# Altium schematic sheet ide_podule-16bit.SchDoc
size 420 x 297 mm
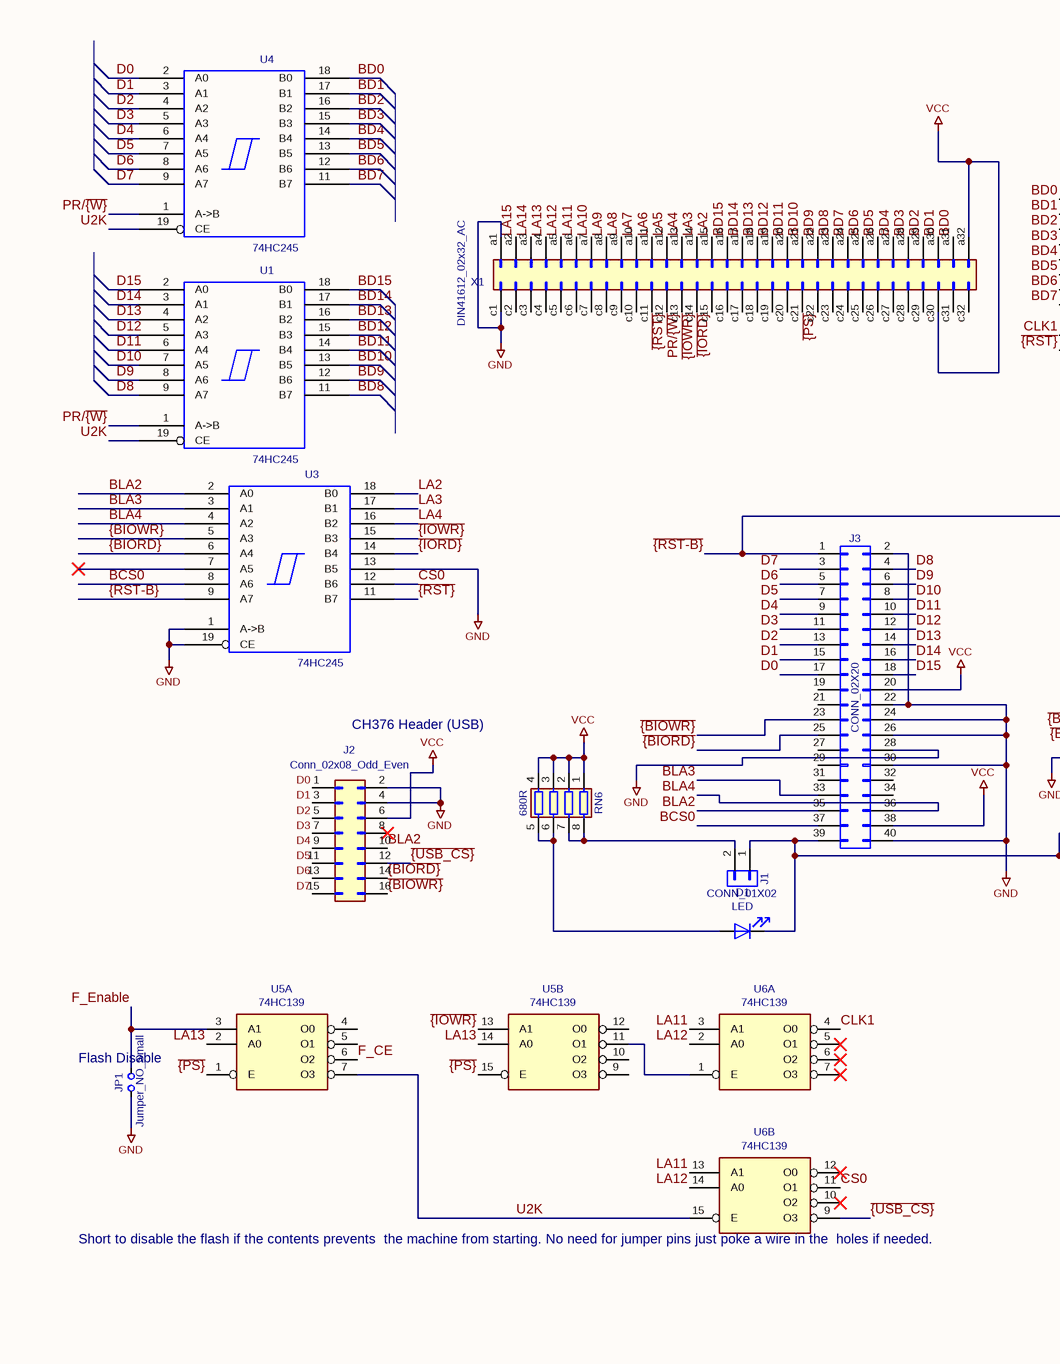
[diagram p0: ide_podule-16bit.SchDoc, left]
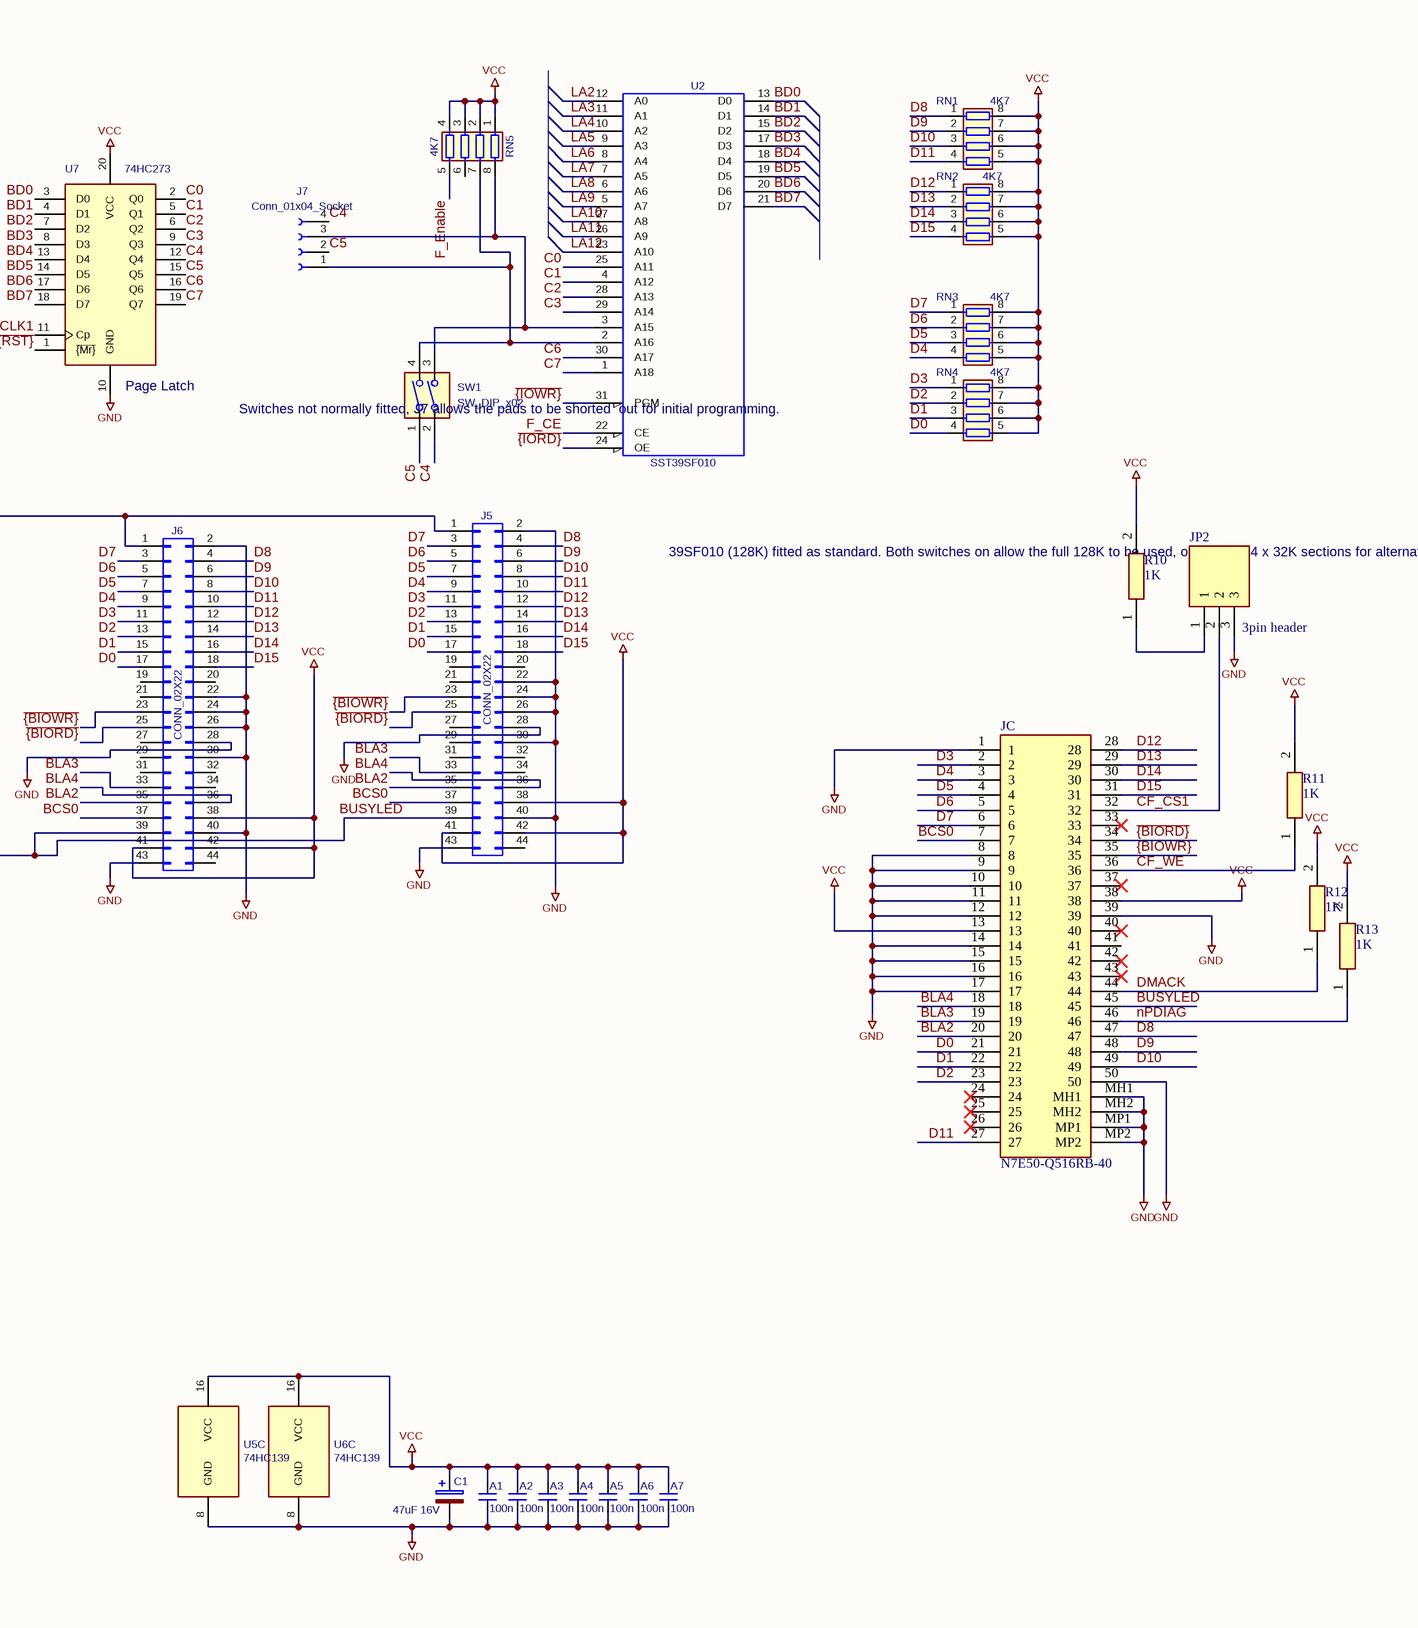
[diagram p1: ide_podule-16bit.SchDoc, right]

## Parts
A1  100n  [RESC2012X50N]
A2  100n  [RESC2012X50N]
A3  100n  [RESC2012X50N]
A4  100n  [RESC2012X50N]
A5  100n  [RESC2012X50N]
A6  100n  [RESC2012X50N]
A7  100n  [RESC2012X50N]
C1  47uF 16V  [CP_Elec_6.3x5.8]
D1  LED  [LED_1206_3216Metric]
J1  CONN_01X02  [PinHeader_1x02_P2.54mm_Vertical]
J2  Conn_02x08_Odd_Even  [CH376-mod]
J3  CONN_02X20  [PinHeader_2x20_P2.54mm_Vertical]
J5  CONN_02X22  [PinHeader_2x22_P2.00mm_Vertical]
J6  CONN_02X22  [IDE-edge-44pinC]
J7  Conn_01x04_Socket  [4 way edge]
JC  N7E50-Q516RB-40  [N7E50Q516RB40]
JP1  Jumper_NO_Small  [PinHeader_1x02_P2.54mm_Vertical]
JP2  3pin header  [HDRV3W64P254_1X3_762X241X838P]
R10  1K  [RESC1608X50N]
R11  1K  [RESC1608X50N]
R12  1K  [RESC1608X50N]
R13  1K  [RESC1608X50N]
RN1  4K7  [R_Array_Convex_4x0603]
RN2  4K7  [R_Array_Convex_4x0603]
RN3  4K7  [R_Array_Convex_4x0603]
RN4  4K7  [R_Array_Convex_4x0603]
RN5  4K7  [R_Array_Convex_4x0603]
RN6  680R  [R_Array_Convex_4x0603]
SW1  SW_DIP_x02  [DIP-4_W7.62mm_Socket]
U1  74HC245  [SOIC-20W_7.5x12.8mm_P1.27mm]
U2  SST39SF010  [PLCC-32_11.4x14.0mm_P1.27mm]
U3  74HC245  [SOIC-20W_7.5x12.8mm_P1.27mm]
U4  74HC245  [SOIC-20W_7.5x12.8mm_P1.27mm]
U5  74HC139  [STC_SOP-16_3.9x9.9mm_P1.27mm]  (parts A,B,C of 3)
U6  74HC139  [STC_SOP-16_3.9x9.9mm_P1.27mm]  (parts A,B,C of 3)
U7  74HC273  [SOIC-20W_7.5x12.8mm_P1.27mm]
X1  DIN41612_02x32_AC  [DIN41612_C_2x32_Male_Horizontal_THT]

## Nets
GND: A1.2 A2.2 A3.2 A4.2 A5.2 A6.2 A7.2 C1.2 J2.2(Pin_2) J2.4(Pin_4) J3.2(P2) J3.22(P22) J3.24(P24) J3.26(P26) J3.28(P28) J3.30(P30) J3.40(P40) J5.2(P2) J5.22(P22) J5.24(P24) J5.26(P26) J5.28(P28) J5.30(P30) J5.40(P40) J5.43(P43) J6.2(P2) J6.22(P22) J6.24(P24) J6.26(P26) J6.28(P28) J6.30(P30) J6.40(P40) J6.43(P43) JC.1 JC.8 JC.9 JC.10 JC.11 JC.12 JC.14 JC.15 JC.16 JC.17 JC.39 JC.50 JC.MH1 JC.MH2 JC.MP1 JC.MP2 JP1.1 JP2.3 U3.1(A->B) U3.13(B5) U3.19(CE) U5.8(GND) U6.8(GND) U7.10(GND) X1.a1(Pin_a1) X1.c1(Pin_c1)
VCC: A1.1 A2.1 A3.1 A4.1 A5.1 A6.1 A7.1 C1.1 J2.6(Pin_6) J3.20(P20) J3.38(P38) J5.38(P38) J5.41(P41) J5.42(P42) J6.38(P38) J6.41(P41) J6.42(P42) JC.13 JC.38 R10.2 R11.2 R12.2 R13.2 RN1.5(R4.2) RN1.6(R3.2) RN1.7(R2.2) RN1.8(R1.2) RN2.5(R4.2) RN2.6(R3.2) RN2.7(R2.2) RN2.8(R1.2) RN3.5(R4.2) RN3.6(R3.2) RN3.7(R2.2) RN3.8(R1.2) RN4.5(R4.2) RN4.6(R3.2) RN4.7(R2.2) RN4.8(R1.2) RN5.1(R1.1) RN5.2(R2.1) RN5.3(R3.1) RN5.4(R4.1) RN6.1(R1.1) RN6.2(R2.1) RN6.3(R3.1) RN6.4(R4.1) U5.16(VCC) U6.16(VCC) U7.20(VCC) X1.a32(Pin_a32) X1.c30(Pin_c30)
BCS0: J3.37(P37) J5.37(P37) J6.37(P37) JC.7 U3.8(A6)
BD0: U2.13(D0) U4.18(B0) U7.3(D0) X1.a31(Pin_a31)
BD1: U2.14(D1) U4.17(B1) U7.4(D1) X1.a30(Pin_a30)
BD2: U2.15(D2) U4.16(B2) U7.7(D2) X1.a29(Pin_a29)
BD3: U2.17(D3) U4.15(B3) U7.8(D3) X1.a28(Pin_a28)
BD4: U2.18(D4) U4.14(B4) U7.13(D4) X1.a27(Pin_a27)
BD5: U2.19(D5) U4.13(B5) U7.14(D5) X1.a26(Pin_a26)
BD6: U2.20(D6) U4.12(B6) U7.17(D6) X1.a25(Pin_a25)
BD7: U2.21(D7) U4.11(B7) U7.18(D7) X1.a24(Pin_a24)
BD8: U1.11(B7) X1.a23(Pin_a23)
BD9: U1.12(B6) X1.a22(Pin_a22)
BD10: U1.13(B5) X1.a21(Pin_a21)
BD11: U1.14(B4) X1.a20(Pin_a20)
BD12: U1.15(B3) X1.a19(Pin_a19)
BD13: U1.16(B2) X1.a18(Pin_a18)
BD14: U1.17(B1) X1.a17(Pin_a17)
BD15: U1.18(B0) X1.a16(Pin_a16)
BLA2: J2.10(Pin_10) J3.35(P35) J5.35(P35) J6.35(P35) JC.20 U3.2(A0)
BLA3: J3.33(P33) J5.33(P33) J6.33(P33) JC.19 U3.3(A1)
BLA4: J3.36(P36) J5.36(P36) J6.36(P36) JC.18 U3.4(A2)
BUSYLED: D1.1(K) J1.1(P1) J3.39(P39) J5.39(P39) J6.39(P39) JC.45
C0: U2.25(A11) U7.2(Q0)
C1: U2.4(A12) U7.5(Q1)
C2: U2.28(A13) U7.6(Q2)
C3: U2.29(A14) U7.9(Q3)
C4: J7.4(Pin_4) SW1.2 U7.12(Q4)
C5: J7.2(Pin_2) SW1.1 U7.15(Q5)
C6: U2.30(A17) U7.16(Q6)
C7: U2.1(A18) U7.19(Q7)
CF_CS1: JC.32 JP2.2
CF_WE: JC.36 R11.1
CLK1: U6.4(O0) U7.11(Cp)
CS0: U3.12(B6) U6.11(O1)
D0: J2.1(Pin_1) J3.17(P17) J5.17(P17) J6.17(P17) JC.21 RN4.4(R4.1) U4.2(A0)
D1: J2.3(Pin_3) J3.15(P15) J5.15(P15) J6.15(P15) JC.22 RN4.3(R3.1) U4.3(A1)
D2: J2.5(Pin_5) J3.13(P13) J5.13(P13) J6.13(P13) JC.23 RN4.2(R2.1) U4.4(A2)
D3: J2.7(Pin_7) J3.11(P11) J5.11(P11) J6.11(P11) JC.2 RN4.1(R1.1) U4.5(A3)
D4: J2.9(Pin_9) J3.9(P9) J5.9(P9) J6.9(P9) JC.3 RN3.4(R4.1) U4.6(A4)
D5: J2.11(Pin_11) J3.7(P7) J5.7(P7) J6.7(P7) JC.4 RN3.3(R3.1) U4.7(A5)
D6: J2.13(Pin_13) J3.5(P5) J5.5(P5) J6.5(P5) JC.5 RN3.2(R2.1) U4.8(A6)
D7: J2.15(Pin_15) J3.3(P3) J5.3(P3) J6.3(P3) JC.6 RN3.1(R1.1) U4.9(A7)
D8: J3.4(P4) J5.4(P4) J6.4(P4) JC.47 RN1.1(R1.1) U1.9(A7)
D9: J3.6(P6) J5.6(P6) J6.6(P6) JC.48 RN1.2(R2.1) U1.8(A6)
D10: J3.8(P8) J5.8(P8) J6.8(P8) JC.49 RN1.3(R3.1) U1.7(A5)
D11: J3.10(P10) J5.10(P10) J6.10(P10) JC.27 RN1.4(R4.1) U1.6(A4)
D12: J3.12(P12) J5.12(P12) J6.12(P12) JC.28 RN2.1(R1.1) U1.5(A3)
D13: J3.14(P14) J5.14(P14) J6.14(P14) JC.29 RN2.2(R2.1) U1.4(A2)
D14: J3.16(P16) J5.16(P16) J6.16(P16) JC.30 RN2.3(R3.1) U1.3(A1)
D15: J3.18(P18) J5.18(P18) J6.18(P18) JC.31 RN2.4(R4.1) U1.2(A0)
DMACK: JC.44 R12.1
F_CE: U2.22(CE) U5.6(O2)
F_Enable: JP1.2 RN5.5(R4.2) U5.3(A1)
LA2: U2.12(A0) U3.18(B0) X1.a15(Pin_a15)
LA3: U2.11(A1) U3.17(B1) X1.a14(Pin_a14)
LA4: U2.10(A2) U3.16(B2) X1.a13(Pin_a13)
LA5: U2.9(A3) X1.a12(Pin_a12)
LA6: U2.8(A4) X1.a11(Pin_a11)
LA7: U2.7(A5) X1.a10(Pin_a10)
LA8: U2.6(A6) X1.a9(Pin_a9)
LA9: U2.5(A7) X1.a8(Pin_a8)
LA10: U2.27(A8) X1.a7(Pin_a7)
LA11: U2.26(A9) U6.3(A1) U6.13(A1) X1.a6(Pin_a6)
LA12: U2.23(A10) U6.2(A0) U6.14(A0) X1.a5(Pin_a5)
LA13: U5.2(A0) U5.14(A0) X1.a4(Pin_a4)
LA14: X1.a3(Pin_a3)
LA15: X1.a2(Pin_a2)
nPDIAG: JC.46 R13.1
PR/~{{W}}: U1.1(A->B) U4.1(A->B) X1.c13(Pin_c13)
U2K: U1.19(CE) U4.19(CE) U5.7(O3) U6.15(E)
~{{BIORD}}: J2.14(Pin_14) J3.25(P25) J5.25(P25) J6.25(P25) JC.34 U3.6(A4)
~{{BIOWR}}: J2.16(Pin_16) J3.23(P23) J5.23(P23) J6.23(P23) JC.35 U3.5(A3)
~{{IORD}}: U2.24(OE) U3.14(B4) X1.c15(Pin_c15)
~{{IOWR}}: U2.31(PGM) U3.15(B3) U5.13(A1) X1.c14(Pin_c14)
~{{PS}}: U5.1(E) U5.15(E) X1.c22(Pin_c22)
~{{RST-B}}: J3.1(P1) J5.1(P1) J6.1(P1) U3.9(A7)
~{{RST}}: U3.11(B7) U7.1(~{{Mr}}) X1.c12(Pin_c12)
~{{USB_CS}}: J2.12(Pin_12) U6.9(O3)
NetD1_2: D1.2(A) RN6.5(R4.2) RN6.6(R3.2)
NetJ1_2: J1.2(P2) RN6.7(R2.2) RN6.8(R1.2)
NetJ7_1: J7.1(Pin_1) RN5.7(R2.2) SW1.4 U2.2(A16)
NetJ7_3: J7.3(Pin_3) RN5.8(R1.2) SW1.3 U2.3(A15)
NetJP2_1: JP2.1 R10.1
NetU5_11: U5.11(O1) U6.1(E)

Not connected (* = marked no-connect by the designer): J2 8(Pin_8)*; J3 19(P19) 21(P21) 27(P27) 29(P29) 31(P31) 32(P32) 34(P34); J5 19(P19) 20(P20) 21(P21) 27(P27) 29(P29) 31(P31) 32(P32) 34(P34) 44(P44); J6 19(P19) 20(P20) 21(P21) 27(P27) 29(P29) 31(P31) 32(P32) 34(P34) 44(P44); JC 24* 25* 26* 33* 37* 40* 41 42* 43*; RN5 6(R3.2); U1 10(GND) 20(VCC); U2 16(GND) 32(VCC); U3 7(A5)* 10(GND) 20(VCC); U4 10(GND) 20(VCC); U5 4(O0) 5(O1) 9(O3) 10(O2) 12(O0); U6 5(O1)* 6(O2)* 7(O3)* 10(O2)* 12(O0)*; X1 c2(Pin_c2) c3(Pin_c3) c4(Pin_c4) c5(Pin_c5) c6(Pin_c6) c7(Pin_c7) c8(Pin_c8) c9(Pin_c9) c10(Pin_c10) c11(Pin_c11) c16(Pin_c16) c17(Pin_c17) c18(Pin_c18) c19(Pin_c19) c20(Pin_c20) c21(Pin_c21) c23(Pin_c23) c24(Pin_c24) c25(Pin_c25) c26(Pin_c26) c27(Pin_c27) c28(Pin_c28) c29(Pin_c29) c31(Pin_c31) c32(Pin_c32)

## Notes on the sheet
- (near U7) Page
  Latch
- Switches not normally fitted,
  J7 allows the pads to be shorted
  out for initial programming.
- (near R10) 39SF010 (128K) fitted as standard.
  Both switches on allow the full
  128K to be used, or treat as
  4 x 32K sections for alternative
  filing systems.
  39SF010 only goes up to A16.
- CH376 Header (USB)
- (near JP1) Flash
  Disable
- (near U6) Short to disable the flash
  if the contents prevents
  the machine from starting.
  No need for jumper pins
  just poke a wire in the
  holes if needed.
- 1
- 2
- 3
- 4
- 5
- 6
- 7
- 8
- A
- B
- C
- D
- E
- Title:
- File: ide_podule-16bit.kicad_sch
- Sheet: /
- F
- KiCad E.D.A.  kicad (5.1.4)-1
- Size: A3
- Date: zondag 28 september 2014
- Rev:
- Id: 1/1

## Library data of the parts
A1-A7 = C_Small: Value: 100n; Footprint: Capacitor_SMD:C_1206_3216Metric_Pad1.33x1.80mm_HandSolder
C1 = CP: Value: 47uF 16V; Footprint: Capacitor_SMD:CP_Elec_6.3x5.8
J1 = CONN_01X02-conn-podule_ide_ics_clone_v3-rescue: Value: CONN_01X02; Footprint: Connector_PinHeader_2.54mm:PinHeader_1x02_P2.54mm_Vertical
J3 = CONN_02X20-conn-podule_ide_ics_clone_v3-rescue: Value: CONN_02X20; Footprint: Connector_PinHeader_2.54mm:PinHeader_2x20_P2.54mm_Vertical
J5 J6 = CONN_02X22-conn-podule_ide_ics_clone_v3-rescue: Value: CONN_02X22
  J5: Footprint: Connector_PinHeader_2.00mm:PinHeader_2x22_P2.00mm_Vertical
  J6: Footprint: Library:IDE-edge-44pinC
JC = N7E50-Q516RB-40: Connector; Manufacturer_Name: 3M; Datasheet Link: http://multimedia.3m.com/mws/media/223587O/3mtm-cf-card-hdr-compactflashtm-type-ii-surfacemount-ts2082.pdf; Height: 4.65mm; Manufacturer_Part_Number: N7E50-Q516RB-40; Mouser Part Number: 517-N7E50-Q516RB-40; Mouser Price/Stock: https://www.mouser.co.uk/ProductDetail/3M-Electronic-Solutions-Division/N7E50-Q516RB-40?qs=U4pz39agNJAOgdzscodSQg%3D%3D
JP2 = TSW-103-07-S-S-LL: Connector; Manufacturer_Name: SAMTEC; Datasheet Link: http://suddendocs.samtec.com/catalog_english/tsw_th.pdf; Height: 8.38mm; Manufacturer_Part_Number: TSW-103-07-S-S-LL; Mouser Part Number: 200-TSW10307SSLL; Mouser Price/Stock: https://www.mouser.co.uk/ProductDetail/Samtec/TSW-103-07-S-S-LL?qs=rU5fayqh%252BE2qFj1BrU5SIQ%3D%3D; Arrow Part Number: TSW-103-07-S-S-LL; Arrow Price/Stock: https://www.arrow.com/en/products/tsw-103-07-s-s-ll/samtec.html?utm_currency=USD&region=nac
R10-R13 = CRCW06031K00FKEI: Resistor; Manufacturer_Name: Vishay; Datasheet Link: http://www.vishay.com/docs/20035/dcrcwe3.pdf; Height: 0.5mm; Manufacturer_Part_Number: CRCW06031K00FKEI; Mouser Part Number: 71-CRCW06031K00FKEI; Mouser Price/Stock: https://www.mouser.co.uk/ProductDetail/Vishay-Dale/CRCW06031K00FKEI?qs=%252B6g0mu59x7LmDUigK4duvw%3D%3D
RN1-RN6 = R_Pack04: Footprint: Resistor_SMD:R_Array_Convex_4x0603
  RN1-RN5: Value: 4K7
  RN6: Value: 680R
U1 U3 U4 = 74HC245-podule_ide_ics_clone_v3-rescue: Value: 74HC245; Footprint: Package_SO:SOIC-20W_7.5x12.8mm_P1.27mm
U2 = SST39SF040-memory-podule_ide_ics_clone_v3-rescue: Value: SST39SF010; Footprint: Package_LCC:PLCC-32_11.4x14.0mm_P1.27mm
U5 U6 = 74LS139: Value: 74HC139; Footprint: Package_SO:STC_SOP-16_3.9x9.9mm_P1.27mm
U7 = 74AHC273: Value: 74HC273; Footprint: Package_SO:SOIC-20W_7.5x12.8mm_P1.27mm
D1 = LED: Value: LED; Footprint: LED_SMD:LED_1206_3216Metric
J2 = Conn_02x08_Odd_Even: Value: Conn_02x08_Odd_Even; Footprint: Library:CH376-mod
J7 = Conn_01x04_Socket: Value: Conn_01x04_Socket; Footprint: Library:4 way edge
JP1 = Jumper_NO_Small: Value: Jumper_NO_Small; Footprint: Connector_PinHeader_2.54mm:PinHeader_1x02_P2.54mm_Vertical
SW1 = SW_DIP_x02: Value: SW_DIP_x02; Footprint: Package_DIP:DIP-4_W7.62mm_Socket
X1 = DIN41612_02x32_AC: Value: DIN41612_02x32_AC; Footprint: Connector_DIN:DIN41612_C_2x32_Male_Horizontal_THT